# EasyEDA Pro project wzh2814685-voltpen_v0-5-3f4d7379.epro, board C-C转接_板厚0.8
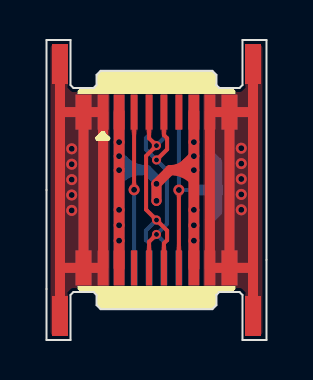
[diagram p7: board, top side]
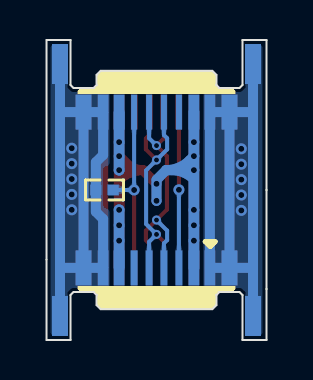
[diagram p8: board, bottom side, seen from below]

Outline 11 x 15 mm; copper layers: Top Layer, Bottom Layer. Coordinates in mm from the lower left corner of the outline.
Outline path: 1.05,15 0,15 0,0 1.05,0 ; 9.95,0 11,0 11,15 9.95,15
Stack: Top Layer 0.035mm / Dielectric1 0.71mm FR4 er 4.5 / Bottom Layer 0.035mm

## Design rules (mm)
spacing safeClearance (default): track to track 0.152, other pairs 0.152 to 0.3
spacing Plane_innerPlane: track to track 0.152, other pairs 0.152 to 0.3
spacing Copper_copperRegion: track to track 0.152, other pairs 0.152 to 0.3
spacing Copper_gge4905: track to track 0.152, other pairs 0.152 to 0.3
spacing Copper_gge4899: track to track 0.152, other pairs 0.152 to 0.3
track width trackWidth (default): min 0.127, default 0.254, max 2.54
differential pair differentialPair (default): width min 0.127, default 0.254, max 2.54; gap min 0.152, default 0.152
pour e146 uses Copper_copperRegion, gge4905
pour e149 uses Copper_copperRegion, gge4899

## Placement (name value [footprint] x y rotation side)
RD1  1k  [R0402]  8.1 7.5 0 bottom
USB3  TYPE-C-16夹板  [TYPE-C-16P夹板]  5.5 2.41 0 bottom
USB234  TYPE-C-16夹板  [TYPE-C-16P夹板]  5.5 12.59 0 top

## Footprints (pads in the part's own frame, mm; a bottom-side part is the same pattern mirrored in y, then rotated)
R0402
  rect 0.566x0.54 smd: 1(-0.433,0) 2(0.433,0)
TYPE-C-16P夹板
  rect 0.8x2 smd: 0(-4.826,1.205) 0(4.826,1.205)
  rect 0.8x2 smd far side: 0(-4.826,1.205) 0(4.826,1.205)
  rect 0.8x1.75 smd: 0(-3.65,-1.2) 0(3.65,-1.2)
  rect 0.8x1.75 smd far side: 0(-3.65,-1.2) 0(3.65,-1.2)
  rect 0.54x1.75 smd: A1(-2.67,-1.2) A4(-1.87,-1.2) A9(1.87,-1.2) A12(2.67,-1.2)
  rect 0.35x1.75 smd: A5(-1.12,-1.2) A6(-0.37,-1.2) A7(0.37,-1.2) A8(1.12,-1.2)
  rect 0.54x1.75 smd far side: B1(2.67,-1.2) B4(1.87,-1.2) B9(-1.87,-1.2) B12(-2.67,-1.2)
  rect 0.3x1.75 smd far side: B5(1.12,-1.2) B6(0.37,-1.2) B7(-0.37,-1.2) B8(-1.12,-1.2)

## Nets
GND: RD1.2 USB3.0 USB3.A1 USB3.A12 USB3.B1 USB3.B12 USB234.0 USB234.A1 USB234.A12 USB234.B1 USB234.B12
VBUS: USB3.A4 USB3.A9 USB3.B4 USB3.B9 USB234.A4 USB234.A9 USB234.B4 USB234.B9
CC1: USB3.A5 USB234.A5
D+: USB3.A6 USB3.B6 USB234.A6 USB234.B6
D-: USB3.A7 USB3.B7 USB234.A7 USB234.B7
VCON: RD1.1 USB3.B5 USB234.B5

Pads without a net: USB3 A8 B8; USB234 A8 B8

## Via types
v1: diameter 0.55, hole 0.3, Top Layer to Bottom Layer, 12 vias
v2: diameter 0.54, hole 0.3, Top Layer to Bottom Layer, 12 vias
v3: diameter 0.5, hole 0.3, Top Layer to Bottom Layer, 2 vias
v4: diameter 0.45, hole 0.25, Top Layer to Bottom Layer, 4 vias

## Routing (per net, layer and track width the routed paths; a pad name or vN(x,y) marks a point on that pad's centre or on a via; arc(x,y) is an arc through that point)
GND: length 210.9
  Top Layer w0.2: 10.33,13.8 10.33,1.2 ; 8.17,11.4 USB234.0 USB3.0 8.17,3.61 8.17,11.4 ; USB234.0 USB3.0 USB3.A1 2.83,11.4 USB234.0
  Top Layer w0.5: USB3.0 0.67,3.61 ; USB3.0 USB234.0 ; USB3.0 USB3.A1 2.83,11.4 USB234.0 ; USB234.0 10.33,11.4 ; USB234.0 USB3.0 ; USB234.0 8.17,11.4 8.17,3.61 USB3.0 ; USB234.0 0.67,11.4 ; USB3.0 10.33,3.61 ; 0.67,13.8 0.67,1.2 ; 10.33,13.8 10.33,1.2
  Bottom Layer w0.2: USB234.0 USB3.0 ; 0.67,13.8 0.67,1.2 ; 10.33,13.8 10.33,1.2
  Bottom Layer w0.5: USB234.0 2.83,11.4 USB3.A1 USB3.0 ; USB234.0 0.67,11.4 ; USB234.0 USB3.0 ; 10.33,13.8 10.33,1.2 ; USB3.0 0.67,3.61 ; USB3.0 8.17,3.61 8.17,6.05 8.53,6.41 RD1.2 8.53,8.89 8.17,9.25 8.17,11.4 USB234.0 ; USB3.0 USB234.0 ; USB3.0 10.33,3.61 ; USB234.0 10.33,11.4 ; 0.67,13.8 0.67,1.2
  vias: v1(1.26,9.56) v1(1.26,8.79) v1(1.26,8.02) v1(1.26,7.25) v1(1.26,6.48) v1(9.74,9.59) v1(9.74,8.82) v1(9.74,8.05) v1(9.74,7.28) v1(9.74,6.51)
VBUS: length 41.1
  Top Layer w0.5: 6.19,8.49 arc(6.82,8.37) 7.37,8.01 ; 6.19,8.49 arc(6.63,8.58) 7.01,8.84 v2(7.37,9.19) ; 6.19,8.49 7.37,8.49 ; 6.19,8.49 v3(5.5,7.81) v3(5.5,6.96)
  Top Layer w0.54: 3.63,11.4 USB3.A4 ; 7.37,11.4 7.37,3.61
  Bottom Layer w0.5: 3.63,8.03 arc(4.15,8.37) 4.75,8.49 5.01,8.49 ; 5.01,8.49 arc(4.38,8.62) 3.85,8.98 v2(3.63,9.19) ; 5.01,8.49 5.5,8.01 v3(5.5,6.96) ; 5.01,8.49 v2(3.63,8.49)
  Bottom Layer w0.54: 7.37,11.4 v2(7.37,8.49) ; 3.63,11.4 USB3.A4 ; 7.37,6.51 7.37,3.61
  vias: v2(3.63,9.89) v2(3.63,6.51) v2(3.63,5.74) v2(3.63,4.97) v2(7.37,9.89) v2(7.37,6.51) v2(7.37,5.74) v2(7.37,4.97)
CC1: length 7.8
  Top Layer w0.2: 4.38,11.4 v1(4.38,7.51)
  Bottom Layer w0.2: v1(4.38,7.51) 4.38,3.61
D+: length 13.2
  Top Layer w0.2: 5.5,6.08 5.5,6 6.03,5.47 6.03,4.99 5.87,4.83 5.87,3.69 ; v4(5.5,6) 4.98,6.52 4.98,9.2 v4(5.5,9.72) 5.13,10.09 5.13,11.4
  Bottom Layer w0.2: 5.87,11.4 5.87,10.09 v4(5.5,9.72) ; 5.13,3.69 5.13,4.83 4.97,4.99 4.97,5.47 5.5,6 5.5,6.08
D-: length 13.2
  Top Layer w0.2: v4(5.5,5.28) 5.13,4.91 5.13,3.61 ; 5.87,11.4 5.87,10.25 6.03,10.09 6.03,9.53 v4(5.5,9)
  Bottom Layer w0.2: 5.13,11.4 5.13,10.25 4.97,10.09 4.97,9.53 v4(5.5,9) 6.02,8.48 6.02,5.8 v4(5.5,5.28) 5.87,4.91 USB3.A7
VCON: length 8.8
  Top Layer w0.2: USB3.B5 v1(6.62,7.5)
  Bottom Layer w0.2: 6.62,11.4 v1(6.62,7.5) RD1.1

## Copper pours and planes (outline as drawn; the poured copper is in the pictures)
GND on Top Layer: 11.12,13.84 11.12,15.04 10.92,15.24 0.1,15.24 -0.18,14.96 -0.18,-0.13 -0.08,-0.23 10.76,-0.23 11.04,0.05
GND on Bottom Layer: 11.22,10.92 11.22,15.12 11.07,15.27 0.12,15.27 -0.21,14.94 -0.21,-0.1 -0.11,-0.2 10.89,-0.2 11.17,0.08

Small or netless copper shapes (teardrops, artwork), in the pictures only: 61 on Top Layer, 53 on Bottom Layer
